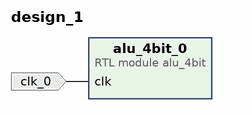
[diagram p0: block diagram of the top level]
# Vivado block design design_1, xc7a200tfbg676-2, Vivado 2026.1
create_bd_design design_1

create_bd_port -dir I -type clk clk_0
set_property -dict {CONFIG.ASSOCIATED_RESET rst CONFIG.FREQ_HZ 100} [get_bd_ports clk_0]

create_bd_cell -type module -reference alu_4bit alu_4bit_0

# ---- connections ----

connect_bd_net -net clk_0_1 [get_bd_ports clk_0] [get_bd_pins alu_4bit_0/clk]

validate_bd_design
save_bd_design
